# Altium schematic sheet POWER-TOP-REV0.SchDoc
size 431 x 279 mm; SheetNumber: 1; SheetTotal: 1
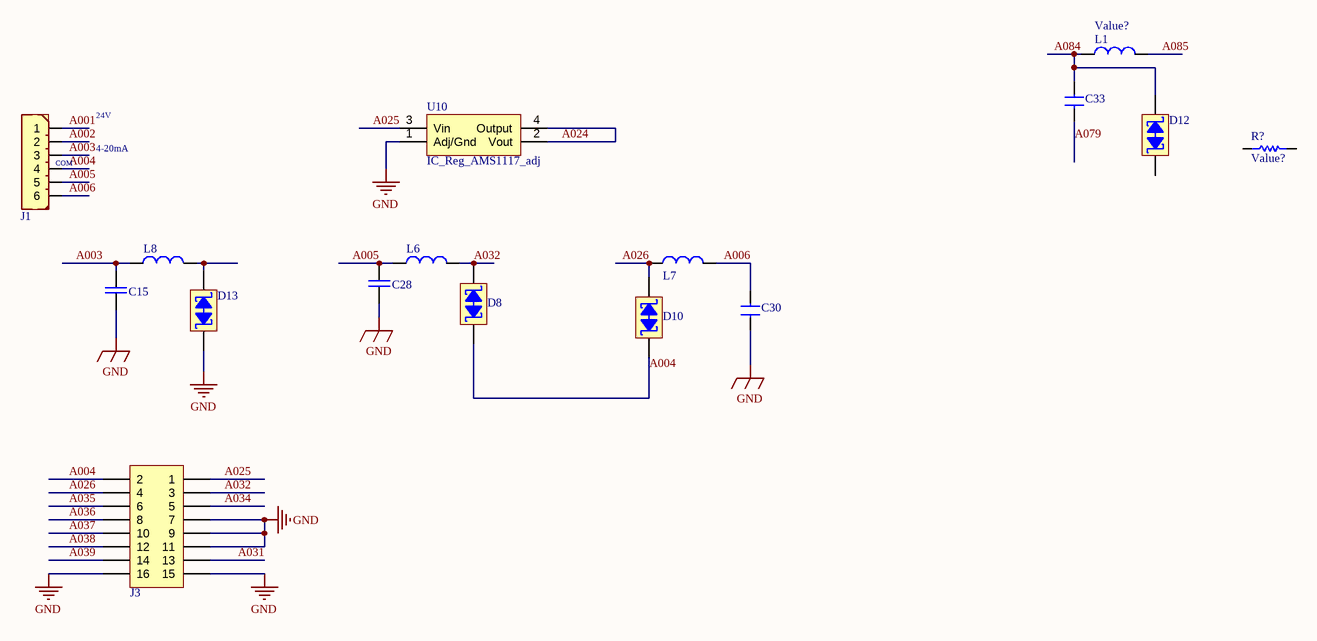
[diagram p0: POWER-TOP-REV0.SchDoc]

## Parts
C15  (no value)  [CAP 1206/3216]
C28  (no value)  [CAP 1206/3216]
C30  CAP  [CAP 0201/0603]  (value not drawn)
C33  CAP  [CAP 0201/0603]  (value not drawn)
D8  SMBJ5.0CA  [1206_L]  (value not drawn)
D10  SMBJ5.0CA  [1206_L]  (value not drawn)
D12  SMBJ5.0CA  [1206_L]  (value not drawn)
D13  SMBJ5.0CA  [1206_L]  (value not drawn)
J1  6'Pin  [CON-Sig-6]  (value not drawn)
J3  8x2  [HDR_THT_8x2F_2.54mm]  (value not drawn)
L1  value Value?  [IND1206]
L6  (no value)  [IND0805]
L7  (no value)  [IND1206]
L8  (no value)  [IND1206]
R?  Value?  [RES 0805 (2012X06L)]
U10  IC_Reg_AMS1117_adj  [SOT223_M]

## Nets
GND: C15.2 C28.2 C30.2 D13.1 J3.7 J3.9 J3.11 J3.15 J3.16 U10.1(Adj/Gnd)
A001: J1.1
A002: J1.2
A003: C15.1 J1.3 L8.1
A004: D8.1 D10.1 J1.4 J3.2
A005: C28.1 J1.5 L6.1
A006: C30.1 J1.6 L7.2
A024: U10.2(Vout) U10.4(Output)
A025: J3.1 U10.3(Vin)
A026: D10.2 J3.4 L7.1
A031: J3.13
A032: D8.2 J3.3 L6.2
A034: J3.5
A035: J3.6
A036: J3.8
A037: J3.10
A038: J3.12
A039: J3.14
A079: C33.2
A084: C33.1 D12.2 L1.1
A085: L1.2
NetD13_2: D13.2 L8.2

Not connected (* = marked no-connect by the designer): D12 1; R? 1 2

## Notes on the sheet
- (near J1) 24V
- (near J1) 4-20mA
- (near J1) COM
- DWG. NO.
- REV.
- SHT.
- THIS DOCUMENT AND THE DATA DISCLOSED HEREIN OR HEREWITH IS THE PROPERTY OF ALTIUM LIMITED AND MAY BE FREELY DISTRIBUTED IN WHOLE. NO RIGHTS ARE RESERVED OR EXPRESS OR IMPLIED WARANTEE GIVEN.
- REVISION
- DESCRIPTION
- DATE
- APPROVED
- ENG:
- APPROVALS
- PROJECT
- DSN:
- CHK:
- REFERENCE DOCUMENTS
- PROJECT REVISION:
- TITLE
- DOCUMENT REVISION:
- DESIGN ITEM:
- BOM:
- FAB DWG:
- PCB DWG:
- ASSY DWG:
- SCALE:
- SIZE
- B
- CAGE CODE
- FILE NAME
- DWG NO.
- SHEET
- OF
- REV

## Library data of the parts
C15 C28 = Cap_Multi_SMD_1206: Bipolar ceramic capacitor SMD; Inflow: inflow?; Type: MultiLayer; Rating: Rating?; Validation: Valid; Package: 1206
D8 D10 D12 D13 = Semi_Diod_TVS_SMBJ5.0CA: TVS Diode; Rating: 5V; Validation: Valid; Inflow: inflow?; Value: SMBJ5.0CA; Package: SMA; Type: TVS
J1 = Con_Power_6: Power Connector 6'Pin; Rating: Rating?; Validation: Valid; Inflow: inflow?; Value: 6'Pin; Package: Package?; Type: Type?
J3 = Con_FPH_8x2_V_THT_2.54: Header, dual row, 16 pin; Inflow: 8101; Rating: Rating?; Validation: NT; Value: 8x2; Package: Package?; Type: Type?
L1 = Ind_SMD: Inductor; Inflow: inflow?; Type: Type?; Rating: Rating?; Validation: Valid; Package: Package?
L6-L8 = Ind_1.8u_SMD_1206: Inductor; Value: 1.8u'H; Rating: Rating?; Type: Type?; Validation: Valid; Inflow: 5243; Package: Package?
R? = Res_SMD_0805: Resistor; Inflow: inflow?; Rating: 0.125W; Validation: Valid; Package: 0805; Type: 10%; Value: Value?
U10 = IC_Reg_AMS1117_adj: Value: adj'V, 1'A; Rating: Rating?; Validation: NT; Inflow: 5224; Package: Package?; Type: Type?